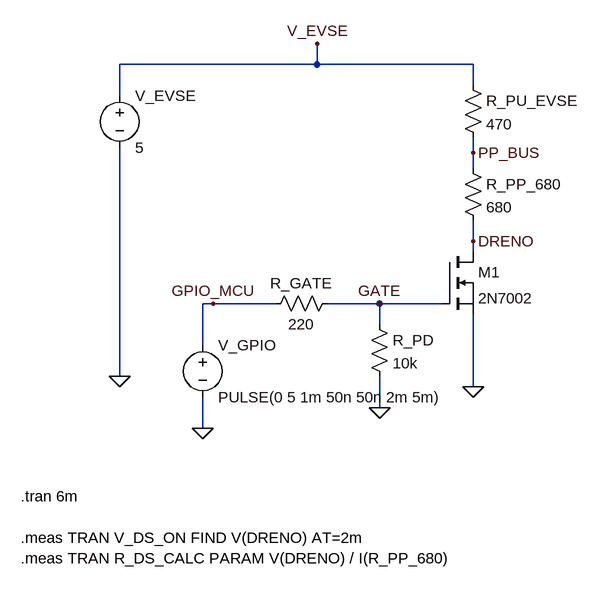
[diagram p0: schematic Driver_2N7002.asc]
Driver_2N7002.asc, the LTspice schematic file:
Version 4.1
SHEET 1 1888 888
WIRE 160 112 160 80
WIRE 160 112 -144 112
WIRE 400 112 160 112
WIRE 400 144 400 112
WIRE -144 160 -144 112
WIRE 400 248 400 224
WIRE 400 272 400 248
WIRE 400 384 400 352
WIRE 400 400 400 384
WIRE 0 480 -16 480
WIRE 96 480 0 480
WIRE 256 480 176 480
WIRE 352 480 256 480
WIRE 256 512 256 480
WIRE -16 544 -16 480
WIRE -144 592 -144 240
WIRE 400 608 400 496
WIRE 256 640 256 592
WIRE -16 672 -16 624
FLAG -144 592 0
FLAG -16 672 0
FLAG 256 640 0
FLAG 400 608 0
FLAG 160 80 V_EVSE
FLAG 400 248 PP_BUS
FLAG 0 480 GPIO_MCU
FLAG 256 480 GATE
FLAG 400 384 DRENO
SYMBOL voltage -144 144 R0
WINDOW 123 0 0 Left 2
WINDOW 39 0 0 Left 2
SYMATTR InstName V_EVSE
SYMATTR Value 5
SYMBOL res 384 128 R0
SYMATTR InstName R_PU_EVSE
SYMATTR Value 470
SYMBOL res 384 256 R0
SYMATTR InstName R_PP_680
SYMATTR Value 680
SYMBOL voltage -16 528 R0
WINDOW 123 0 0 Left 2
WINDOW 39 0 0 Left 2
SYMATTR InstName V_GPIO
SYMATTR Value PULSE(0 5 1m 50n 50n 2m 5m)
SYMBOL res 192 464 R90
WINDOW 0 0 56 VBottom 2
WINDOW 3 32 56 VTop 2
SYMATTR InstName R_GATE
SYMATTR Value 220
SYMBOL res 240 496 R0
SYMATTR InstName R_PD
SYMATTR Value 10k
SYMBOL nmos 352 400 R0
SYMATTR InstName M1
SYMATTR Value 2N7002
TEXT -296 776 Left 2 !.tran 6m
TEXT -296 840 Left 2 !.meas TRAN V_DS_ON FIND V(DRENO) AT=2m
TEXT -296 872 Left 2 !.meas TRAN R_DS_CALC PARAM V(DRENO) / I(R_PP_680)

The netlist it stands for:
* Driver_2N7002.asc
V_EVSE V_EVSE 0 5
R_PU_EVSE V_EVSE PP_BUS 470
R_PP_680 PP_BUS DRENO 680
V_GPIO GPIO_MCU 0 PULSE(0 5 1m 50n 50n 2m 5m)
R_GATE GATE GPIO_MCU 220
R_PD GATE 0 10k
M1 DRENO GATE 0 0 2N7002
.model NMOS NMOS
.model PMOS PMOS
.lib standard.mos
.tran 6m
.meas TRAN V_DS_ON FIND V(DRENO) AT=2m
.meas TRAN R_DS_CALC PARAM V(DRENO) / I(R_PP_680)
.backanno
.end